# Altium schematic sheet LDO.SchDoc
size A; SheetNumber: 6; SheetTotal: 8
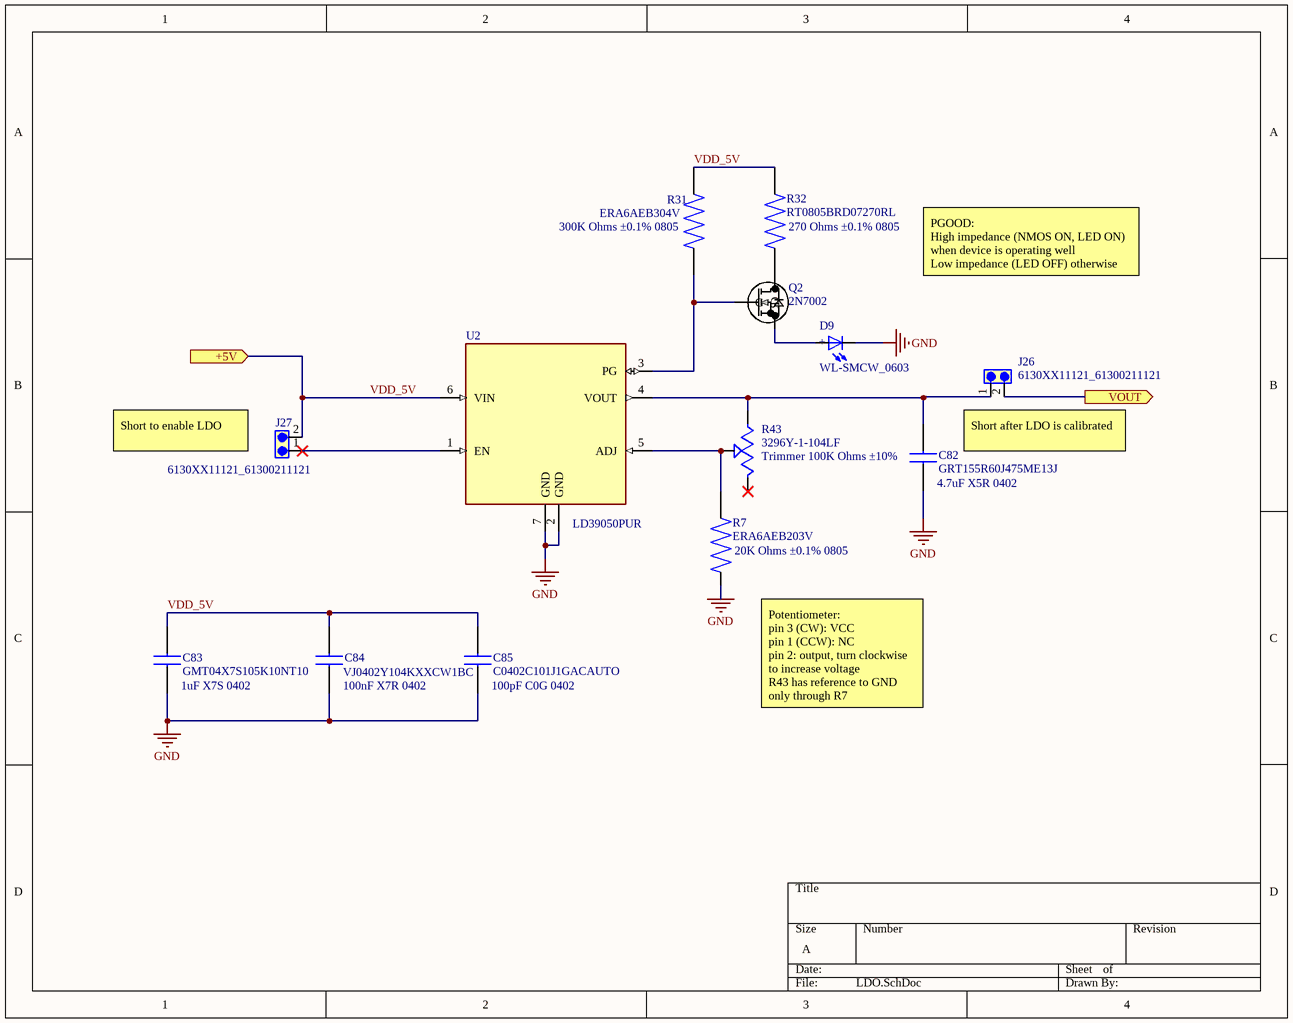
[diagram p0: LDO.SchDoc]

## Parts
C82  GRT155R60J475ME13J  [CAPC1005X60N]
C83  GMT04X7S105K10NT10  [CAPC1005X55N]
C84  VJ0402Y104KXXCW1BC  [CAPC1005X55N]
C85  C0402C101J1GACAUTO  [CAPC1005X55N]
D9  WL-SMCW_0603  [WL-SMCW_0603]
J26  6130XX11121_61300211121  [61300211121]
J27  6130XX11121_61300211121  [61300211121]
Q2  2N7002  [SOT-23TO-236_318-08_ONS]
R7  ERA6AEB203V  [RES_ERA6AEB203V]
R31  ERA6AEB304V  [RES_ERA6AEB304V]
R32  RT0805BRD07270RL  [RESC2012X60N]
R43  3296Y-1-104LF  [TRIM_3296Y-1-104LF]
U2  LD39050PUR  [SON95P300X300X100-7N]

## Ports
+5V (in), VOUT (out)

## Nets
GND: C82.1 C83.1 C84.1 C85.1 D9.1(NEG) R7.1 U2.2(GND) U2.7(GND)
VDD_5V: C83.2 C84.2 C85.2 J27.2 R31.1 R32.2 U2.6(VIN) ; port +5V
VOUT: J26.2 ; port VOUT
NetC82_2: C82.2 J26.1 R43.3(CW) U2.4(VOUT)
NetD9_2: D9.2(POS) Q2.2(S)
NetJ27_1: J27.1 U2.1(EN)
NetQ2_1: Q2.1(G) R31.2 U2.3(PG)
NetQ2_3: Q2.3(D) R32.1
NetR7_2: R7.2 R43.2(WIPER) U2.5(ADJ)

Not connected (* = marked no-connect by the designer): R43 1(CCW)*

## Notes on the sheet
- (near R31) 300K Ohms ±0.1% 0805
- (near R32) 270 Ohms ±0.1% 0805
- PGOOD:
  High impedance (NMOS ON, LED ON) when device is operating well
  Low impedance (LED OFF) otherwise
- (near J27) Short to enable LDO
- (near R43) Trimmer 100K Ohms ±10%
- (near C82) 4.7uF X5R 0402
- Short after LDO is calibrated
- (near R7) 20K Ohms ±0.1% 0805
- (near C83) 1uF X7S 0402
- (near C84) 100nF X7R 0402
- (near C85) 100pF C0G 0402
- (near R7) Potentiometer:
  pin 3 (CW): VCC
  pin 1 (CCW): NC
  pin 2: output, turn clockwise to increase voltage
  R43 has reference to GND only through R7
- (in symbol WL-SMCW_0603) +

## Library data of the parts
C82 = GRT155R60J475ME13J: SMD capacitor X5R(EIA) with capacitance 4.7uF Tol.20%. Rated voltage 6.3Vdc 85C; MF: Murata; SnapEDA_Link: https://www.snapeda.com/parts/GRT155R60J475ME13J/Murata/view-part/?ref=snap; Package: 1005 Taiyo Yuden; Value: *; MP: GRT155R60J475ME13J; Check_prices: https://www.snapeda.com/parts/GRT155R60J475ME13J/Murata/view-part/?ref=eda
C83 = GMT04X7S105K10NT10: 1 µF ±10% 10V Ceramic Capacitor X7S 0402 (1005 Metric); MF: Vishay Vitramon; MP: VJ0402Y104KXXCW1BC; SnapEDA_Link: https://www.snapeda.com/parts/VJ0402Y104KXXCW1BC/Vishay/view-part/?ref=snap; Package: 0402-2 VISHAY; Value: *; Check_prices: https://www.snapeda.com/parts/VJ0402Y104KXXCW1BC/Vishay/view-part/?ref=eda
C84 = VJ0402Y104KXXCW1BC: 0.1 ÂµF Â±10% 25V Ceramic Capacitor X7R 0402 (1005 Metric); MF: Vishay Vitramon; SnapEDA_Link: https://www.snapeda.com/parts/VJ0402Y104KXXCW1BC/Vishay/view-part/?ref=snap; Package: 0402-2 VISHAY; Value: *; MP: VJ0402Y104KXXCW1BC; Check_prices: https://www.snapeda.com/parts/VJ0402Y104KXXCW1BC/Vishay/view-part/?ref=eda
C85 = C0402C101J1GACAUTO: 100 pF ±5% 100V Ceramic Capacitor C0G, NP0 0402 (1005 Metric); MF: {'manufacturer': u'KEMET'}; Package: None; Price: None; Value: *; MP: C0402C101J1GACAUTO; Availability: Unavailable
D9 = WL-SMCW_0603: 0603, Green Typ.(@20mA): 520nm, 430mcd, 3.2V, 140Â° InGaN; MF: Wurth Electronics; MP: 150060GS75000; SnapEDA_Link: https://www.snapeda.com/parts/150060GS75000/Wurth+Electronics/view-part/?ref=snap; Package: 0603 WÃ¼rth Elektronik; Value: *; Check_prices: https://www.snapeda.com/parts/150060GS75000/Wurth+Electronics/view-part/?ref=eda
J26 J27 = 6130XX11121_61300211121: MF: {'manufacturer': u'Wurth Electronics'}; Package: None; Price: None; Value: *; MP: 61300211121; Availability: Unavailable; ComponentLink1Description: Digikey link; ComponentLink1URL: https://www.digikey.com/en/products/detail/w%C3%BCrth-elektronik/61300211121/4846823
Q2 = 2N7002: N-Channel 60 V 115mA (Ta) 200mW (Ta) Surface Mount SOT-23-3; Manufacturer_Name: onsemi; Copyright: Copyright (C) 2026 Ultra Librarian. All rights reserved.; Manufacturer_Part_Number: 2N7002
R7 = ERA6AEB203V: RES SMD 20K OHM 0.1% 1/8W 0805; Availability: Unavailable; Price: None; Package: None; Value: *; MP: ERA6AEB203V; ComponentLink1Description: Digikey link; ComponentLink1URL: https://www.digikey.com/en/products/detail/panasonic-industry/ERA-6AEB203V/1465780?_gl=1*16ggu6x*_up*MQ..*_gs*MQ..&gclid=CjwKCAjw6f3RBhApEiwAMaCqWWAys7UYOKri6355z56lT8wD9j8kH64REZKYwhM8W5opH-dHb2-LKxoC2UMQAvD_BwE&gclsrc=aw.ds&gbraid=0AAAAADrbLliUt3fRxN84rEH66mf2IHcf7
R31 = ERA6AEB304V: RES SMD 300K OHM 0.1% 1/8W 0805; Availability: Unavailable; MP: ERA6AEB304V; Value: *; Price: None; Package: None; ComponentLink1Description: Digikey link; ComponentLink1URL: https://www.digikey.com/en/products/detail/panasonic-industry/ERA-6AEB304V/1465808
R32 = RT0805BRD07270RL: 270 Ohms ±0.1% 0.125W, 1/8W Chip Resistor 0805 (2012 Metric) Thin Film; Package: None; Price: None; Value: *; MP: RT0805BRD07270RL; Availability: Unavailable
R43 = 3296Y-1-104LF: 100 kOhms 0.5W, 1/2W PC Pins Through Hole Trimmer Potentiometer Cermet 25.0 Turn Top Adjustment; MP: 3296Y-1-104LF; Availability: Unavailable; Value: *; Package: None; Price: None
U2 = LD39050PUR: Linear Voltage Regulator IC 1 Output 500mA 6-DFN _3x3_; MF: STMicroelectronics; Package: DFN-6 STMicroelectronics; SnapEDA_Link: https://www.snapeda.com/parts/LD39050PUR/STMicroelectronics/view-part/493713/?ref=snap; MP: LD39050PUR; Value: *; Digi-Key_Part_Number: 497-8717-1-ND; Digi-Key_Purchase_URL: https://www.digikey.com/product-detail/en/stmicroelectronics/LD39050PUR/497-8717-1-ND/2039902?utm_source=snapeda&utm_medium=aggregator&utm_campaign=symbol; ComponentLink1Description: Digikey link; ComponentLink1URL: https://www.digikey.com/en/products/detail/LD39050PUR/497-8717-1-ND/2039902